# EasyEDA Pro project htx-studio-project_kpilekig-42ad306f.epro, board Controller
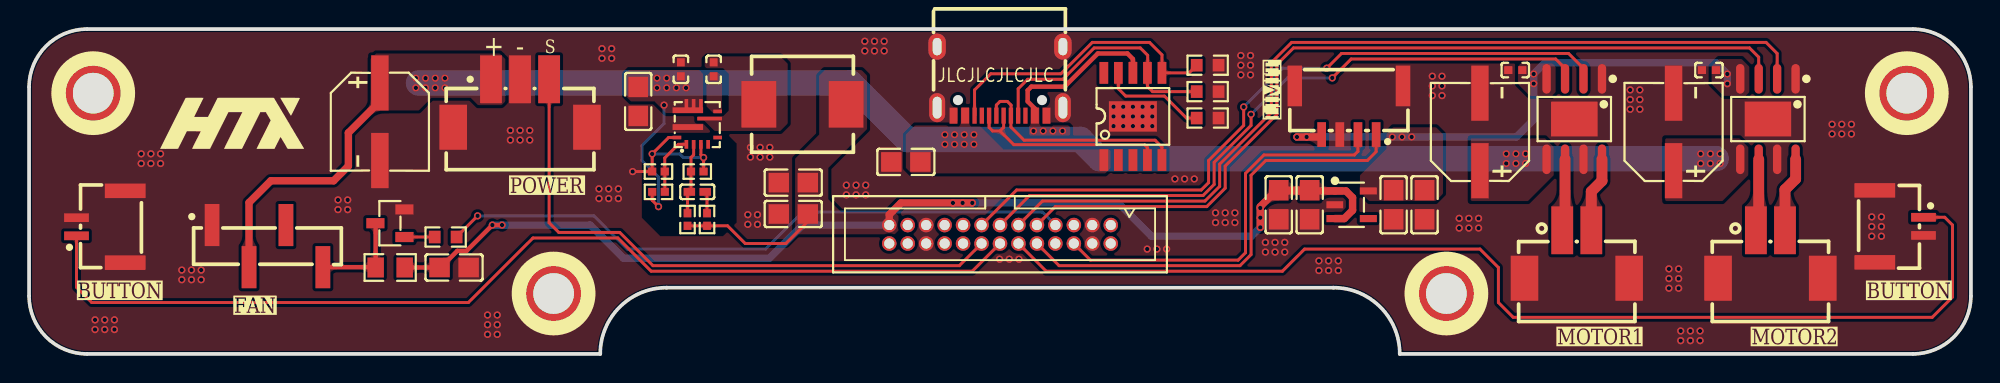
[diagram p6: board, top side]
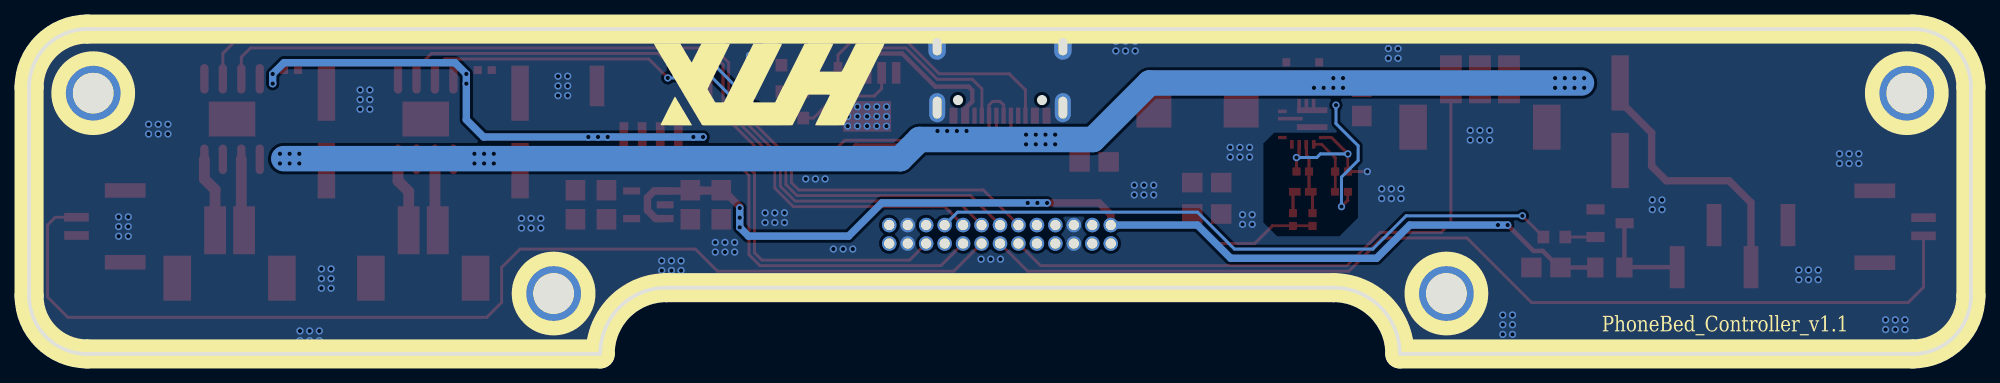
[diagram p7: board, bottom side, seen from below]

Outline 133.6 x 22.36 mm; copper layers: Top Layer, Bottom Layer. Coordinates in mm from the lower left corner of the outline.
Outline path: 0,18.36 arc(1.17,21.19) 4,22.36 129.6,22.36 arc(132.43,21.19) 133.6,18.36 133.6,4 arc(132.43,1.17) 129.6,0 94.31,0 arc(92.97,3.23) 89.74,4.56 43.86,4.56 arc(40.63,3.23) 39.3,0 4,0 arc(1.17,1.17) 0,4 0,18.36
Stack: Top Layer 0.035mm / Dielectric1 1.51mm FR4 er 4.5 / Bottom Layer 0.035mm

## Design rules (mm)
spacing copperThickness1oz (default): track to track 0.102, other pairs 0.152 to 0.3
spacing copperThickness2oz: track to track 0.203, other pairs 0.152 to 0.3
spacing Plane_innerPlane: track to track 0.102, other pairs 0.152 to 0.3
spacing Copper_copperRegion: track to track 0.102, other pairs 0.152 to 0.3
track width copperThickness1oz (default): min 0.127, default 0.203, max 2.54
track width copperThickness2oz: min 0.203, default 0.254, max 2.54
differential pair differentialPair (default): width min 0.127, default 0.254, max 2.54; gap min 0.152, default 0.152
net +3.3V uses copperRegion_copperThickness1oz
pour e438 uses Copper_copperRegion, copperRegion_Copper_copperRegion
pour e440 uses Copper_copperRegion, copperRegion_Copper_copperRegion
pour e442 uses Copper_copperRegion, copperRegion_Copper_copperRegion
pour e444 uses Copper_copperRegion, copperRegion_Copper_copperRegion
pour e446 uses Copper_copperRegion, copperRegion_Copper_copperRegion
pour e448 uses Copper_copperRegion, copperRegion_Copper_copperRegion
pour e450 uses Copper_copperRegion, copperRegion_Copper_copperRegion
pour e452 uses Copper_copperRegion, copperRegion_Copper_copperRegion
pour e454 uses Copper_copperRegion, copperRegion_Copper_copperRegion
pour e456 uses Copper_copperRegion, copperRegion_Copper_copperRegion
pour e458 uses Copper_copperRegion, copperRegion_Copper_copperRegion
pour e460 uses Copper_copperRegion, copperRegion_Copper_copperRegion
pour e658 uses Copper_copperRegion, copperRegion_Copper_copperRegion
pour e674 uses Copper_copperRegion, copperRegion_Copper_copperRegion

## Placement (name value [footprint] x y rotation side)
C1  22uF  [C0805]  60.32 13.22 0 top
C2  100uF  [CAP-SMD_BD6.3-L6.6-W6.6-FD-1]  24.14 15.98 270 top
C3  100pF  [C0402]  45.97 11.16 0 top
C4  10uF  [C0805]  88.11 10.27 90 top
C5  1uF  [C0805]  85.98 10.27 270 top
C6  10uF  [C0805]  93.88 10.27 90 top
C7  1uF  [C0805]  96.01 10.27 90 top
C8  100nF  [C0402#2]  47.1 19.59 90 top
C9  100nF  [C0402#2]  44.84 19.59 90 top
C10  22uF  [C0805]  52.58 9.63 0 top
C11  22uF  [C0805]  29.24 5.95 180 top
C12  22uF  [C0805]  52.58 11.79 0 top
C13  4.7uF  [C0805]  41.91 17.38 90 top
C15  100nF  [C0402#2]  102.25 19.54 0 top
C16  100uF  [CAP-SMD_BD6.3-L6.6-W6.6-FD-1]  99.82 15.28 90 top
C17  100nF  [C0402#2]  115.57 19.54 0 top
C18  100uF  [CAP-SMD_BD6.3-L6.6-W6.6-FD-1]  113.14 15.28 90 top
CN1  X1270WV-2x13A-9TV01  [IDC-TH_X1270WV-2X13A-6TV01]  66.8 8.24 180 top
CN2  WAFER-GH1.25-2PLB  [CONN-TH_2P-P1.25_XUNPU_WAFER-GH1.25-2PLB]  4.94 8.75 90 top
CN3  WAFER-GH1.25-2PLB  [CONN-TH_2P-P1.25_XUNPU_WAFER-GH1.25-2PLB]  128.66 8.78 270 top
L1  3.3uH  [IND-SMD_L7.0-W6.6]  53.21 17.18 0 top
LDO1  ME6211C33M5G-N  [SOT-23-5_L3.0-W1.7-P0.95-LS2.8-BL]  90.99 10.27 270 top
NOREF  -  [Pad_e199]  36.09 4.16 0 top
NOREF#2  -  [Pad_e198]  4.41 17.95 0 top
NOREF#3  -  [Pad_e201]  97.51 4.16 0 top
NOREF#4  -  [Pad_e200]  129.19 17.95 0 top
Q1  AO3400A  [SOT-23-3_L2.9-W1.3-P1.90-LS2.4-BR]  24.83 9 0 top
R1  5.1kΩ  [R0603]  81.09 18.06 180 top
R2  24kΩ  [R0603]  81.09 16.24 0 top
R3  5.1kΩ  [R0603]  81.09 19.87 180 top
R4  20kΩ  [R0402]  46.64 9.25 90 top
R5  73.2kΩ  [R0402]  45.3 9.25 270 top
R6  10kΩ  [R0402]  45.97 12.55 0 top
R7  2kΩ  [R0805]  24.84 5.95 180 top
R8  30kΩ  [R0402]  43.3 12.55 0 top
R9  10Ω  [R0603]  28.66 8.05 180 top
R10  169kΩ  [R0402]  43.31 11.16 180 top
U1  CH224A  [ESSOP-10_L4.9-W3.9-P1.0-LS6.0-TL-EP]  75.94 16.35 0 top
U2  DZ254S-11-04-50  [HDR-SMD_4P-P2.54-V-M-S4.8_DZ254S-11-04-50]  16.4 7.42 0 top
U3  TPS56637RPAR  [VQFN-HR-10_L3.0-W3.0_RPA]  45.97 15.79 90 top
U4  DRV8870DDAR  [HSOP-8_L5.0-W4.0-P1.27-LS6.2-BL-EP]  106.31 16.17 180 top
U5  WAFER-PH2.0-2PLB  [CONN-TH_2P-P2.00_XUNPU_WAFER-PH2.0-2PLB]  106.48 6.86 0 top
U6  DRV8870DDAR  [HSOP-8_L5.0-W4.0-P1.27-LS6.2-BL-EP]  119.63 16.17 180 top
U7  WAFER-PH2.0-2PLB  [CONN-TH_2P-P2.00_XUNPU_WAFER-PH2.0-2PLB]  119.8 6.86 0 top
U8  WAFER-PH2.0-3PLB  [CONN-SMD_3P-P2.00_XUNPU_WAFER-PH2.0-3PLB]  33.78 17.26 0 top
U9  WAFER-GH1.25-4PLB  [CONN-SMD_4P-P1.25_XUNPU_WAFER-GH1.25-4PLB]  90.8 16.77 180 top
USB1  TYPE-C 16PIN 2MD(073)  [USB-C-SMD_TYPE-C-6PIN-2MD-073]  66.8 18.78 180 top

## Footprints (pads in the part's own frame, mm; a bottom-side part is the same pattern mirrored in y, then rotated)
C0402
  rect 0.79x0.54 smd: 1(-0.545,0) 2(0.545,0)
C0402#2
  rect 0.566x0.54 smd: 1(-0.483,0) 2(0.483,0)
C0805
  rect 1.41x1.35 smd: 1(-1,0) 2(1,0)
CAP-SMD_BD6.3-L6.6-W6.6-FD-1
  rect 3.8x1.2 smd: 1(-2.67,0) 2(2.67,0)
CONN-SMD_3P-P2.00_XUNPU_WAFER-PH2.0-3PLB
  rect 1.5x3.3 smd: 1(-2,1.65) 2(0,1.65) 3(2,1.65)
  rect 1.9x3.1 smd: 4(4.6,-1.65) 5(-4.6,-1.65)
CONN-SMD_4P-P1.25_XUNPU_WAFER-GH1.25-4PLB
  rect 0.6x1.7 smd: 1(-1.875,1.675) 2(-0.625,1.675) 3(0.625,1.675) 4(1.875,1.675)
  rect 1x2.8 smd: 5(-3.725,-1.675) 6(3.725,-1.675)
CONN-TH_2P-P1.25_XUNPU_WAFER-GH1.25-2PLB
  rect 0.6x1.7 smd: 1(-0.625,1.675) 2(0.625,1.675)
  rect 1x2.8 smd: 3(2.475,-1.675) 4(-2.475,-1.675)
CONN-TH_2P-P2.00_XUNPU_WAFER-PH2.0-2PLB
  rect 1.5x3.3 smd: 1(-1,1.65) 2(1,1.65)
  rect 1.9x3.1 smd: 3(3.6,-1.65) 4(-3.6,-1.65)
ESSOP-10_L4.9-W3.9-P1.0-LS6.0-TL-EP
  rect 0.6x1.5 smd: 1(-2,-3) 2(-1,-3) 3(0,-3) 4(1,-3) 5(2,-3) 6(2,3) 7(1,3) 8(0,3) 9(-1,3) 10(-2,3)
  rect 3.3x2.1 smd: 11(0,0)
HDR-SMD_4P-P2.54-V-M-S4.8_DZ254S-11-04-50
  rect 1.02x2.9 smd: 1(-3.81,1.45) 2(-1.27,-1.45) 3(1.27,1.45) 4(3.81,-1.45)
HSOP-8_L5.0-W4.0-P1.27-LS6.2-BL-EP
  oval 0.574x2.038 smd: 1(-1.905,-2.769) 2(-0.635,-2.769) 3(0.635,-2.769) 4(1.905,-2.769) 5(1.905,2.769) 6(0.635,2.769) 7(-0.635,2.769) 8(-1.905,2.769)
  rect 3.2x2.4 smd: 9(0,0)
IDC-TH_X1270WV-2X13A-6TV01
  round 1 hole 0.7: 1(-7.62,-0.635) 2(-7.62,0.635) 3(-6.35,-0.635) 4(-6.35,0.635) 5(-5.08,-0.635) 6(-5.08,0.635) 7(-3.81,-0.635) 8(-3.81,0.635) 9(-2.54,-0.635) 10(-2.54,0.635) 11(-1.27,-0.635) 12(-1.27,0.635) 13(0,-0.635) 14(0,0.635) 15(1.27,-0.635) 16(1.27,0.635) 17(2.54,-0.635) 18(2.54,0.635) 19(3.81,-0.635) 20(3.81,0.635) 21(5.08,-0.635) 22(5.08,0.635) 23(6.35,-0.635) 24(6.35,0.635) 25(7.62,-0.635) 26(7.62,0.635)
IND-SMD_L7.0-W6.6
  rect 2.4x3.2 smd: 1(-3,0) 2(3,0)
Pad_e198
  round 4 hole 2.8: 1(0,0)
Pad_e199
  round 4 hole 2.8: 1(0,0)
Pad_e200
  round 4 hole 2.8: 1(0,0)
Pad_e201
  round 4 hole 2.8: 1(0,0)
R0402
  rect 0.566x0.54 smd: 1(-0.433,0) 2(0.433,0)
R0603
  rect 0.806x0.864 smd: 1(-0.753,0) 2(0.753,0)
R0805
  rect 1.133x1.377 smd: 1(-1,0) 2(1,0)
SOT-23-3_L2.9-W1.3-P1.90-LS2.4-BR
  rect 1.25x0.7 smd: 1(1,-0.95) 2(1,0.95) 3(-1,0)
SOT-23-5_L3.0-W1.7-P0.95-LS2.8-BL
  rect 0.49x1.157 smd: 1(-0.95,-1.153) 2(0,-1.153) 3(0.95,-1.153)
  rect 0.49x1.175 smd: 4(0.95,1.153) 5(-0.95,1.153)
USB-C-SMD_TYPE-C-6PIN-2MD-073
  rect 0.55x1.1 smd: 1(-3.2,2.375) 2(-2.4,2.375) 11(2.4,2.375) 12(3.2,2.375)
  rect 0.3x1.1 smd: 3(-1.75,2.375) 4(-1.25,2.375) 5(-0.75,2.375) 6(-0.25,2.375) 7(0.25,2.375) 8(0.75,2.375) 9(1.25,2.375) 10(1.75,2.375)
  oval 1.1x2 hole 0.6x1.5: 13(-4.325,1.825) 14(4.325,1.825)
  oval 1.2x1.8 hole 0.6x1.2: 13(-4.325,-2.375) 14(4.325,-2.375)
VQFN-HR-10_L3.0-W3.0_RPA
  rect 0.6x0.25 smd: 1(-1.36,0.75) 2(-1.36,0.25) 3(-1.36,-0.25) 4(-1.36,-0.75)
  rect 0.25x0.6 smd: 5(-0.89,-1.4) 7(0.91,-1.4) 10(-0.89,1.4)
  rect 0.25x1.7 smd: 6(0.41,-0.85)
  rect 0.4x2.1 smd: 8(0.99,0.65) 9(-0.17,0.65)
  rect 0.8x0.25 smd: 8(1.36,0.75) 8(1.36,0.25) 8(1.36,-0.25)

## Nets
As in the schematic.

Pads without a net: CN1 1 2 5 17 19 23 24 26; LDO1 4; NOREF 1; NOREF#2 1; NOREF#3 1; NOREF#4 1; U1 2 3 10; U2 3; U3 4 5; USB1 3 9

## Via types
v1: diameter 0.5, hole 0.3, Top Layer to Bottom Layer, 221 vias

## Routing (per net, layer and track width the routed paths; a pad name or vN(x,y) marks a point on that pad's centre or on a via; arc(x,y) is an arc through that point)
+3.3V: length 36.3
  Top Layer w0.508: v1(87.23,14.94) v1(87.9,14.94) 88.76,14.94 U9.4
  Bottom Layer w0.508: v1(116.84,18.6) v1(116.84,19.27) 116.06,20.05 104.29,20.05 v1(103.52,19.27) v1(103.52,18.6) 103.52,16.12 102.33,14.94 v1(95.12,14.94) v1(94.46,14.94) v1(93.79,14.94) v1(87.9,14.94) v1(87.23,14.94)
+5V: length 90.5
  Top Layer w0.203: R5.2 R4.1 48.06,8.82 49.27,7.6 52.07,7.6 53.58,9.11 C10.2
  Top Layer w0.305: v1(32.54,8.87) v1(31.88,8.87) 30.1,7.09 29.46,7.09 28.32,5.95 C11.2 R7.1
  Top Layer w0.508: 87.36,11.22 86.03,11.22 C5.1 ; 87.36,11.22 87.31,11.27 ; 87.36,11.22 LDO1.1 90.6,11.22 91.06,10.76 91.06,9.89 90.49,9.32 LDO1.3 ; CN1.25 59.18,9.59 59.99,10.39 v1(63.56,10.39) v1(64.23,10.39) v1(64.9,10.39) ; 87.31,11.27 C5.1 ; 87.31,11.27 C4.2 ; C5.1 85.83,11.27 84.71,10.14 v1(84.71,10.05) v1(84.71,9.38) v1(84.71,8.71)
  Bottom Layer w0.508: CN1.25 53.21,8.87 50.92,6.58 40.89,6.58 38.61,8.87 v1(32.54,8.87) v1(31.88,8.87) ; v1(63.56,10.39) v1(64.23,10.39) v1(64.9,10.39) 74.93,10.39 77.21,8.11 84.1,8.11 v1(84.71,8.71) v1(84.71,9.38) v1(84.71,10.05)
+12V: length 131
  Top Layer w0.203: R10.2 42.87,10.57 v1(43.31,10.14)
  Top Layer w0.305: U1.8 75.94,20.3 75.56,20.68 73.53,20.68 71.25,18.4 68.96,18.4 68.7,18.14 68.7,17.38 69.2,16.88 USB1.2
  Top Layer w0.508: C2.1 24.14,17.39 21.97,15.22 21.97,12.94 20.95,11.92 16.63,11.92 15.13,10.42 U2.2
  Bottom Layer w0.203: v1(43.31,10.14) 43.31,12.17 42.16,13.32 42.16,14.33 43.69,15.86 v1(43.69,17.13)
  Bottom Layer w1.75: 116.08,13.44 73.66,13.44 72.34,14.76 60.4,14.76 56.51,18.65 26.8,18.65
  vias: v1(26.61,18.98) v1(26.61,18.32) v1(27.28,18.98) v1(27.28,18.32) v1(27.94,18.98) v1(27.94,18.32) v1(28.61,18.98) v1(28.61,18.32) v1(43.2,18.98) v1(43.2,18.32) v1(43.87,18.98) v1(43.87,18.32) v1(44.53,18.32) v1(45.2,18.32) v1(63.01,15.09) v1(63.01,14.43) v1(63.67,15.09) v1(63.67,14.43) v1(64.34,15.09) v1(64.34,14.43) v1(65.01,15.09) v1(65.01,14.43) v1(69.1,15.35) v1(69.77,15.35) v1(70.44,15.35) v1(71.1,15.35) v1(101.63,13.78) v1(101.63,13.11) v1(102.29,13.78) v1(102.29,13.11) v1(102.96,13.78) v1(102.96,13.11) v1(115.01,13.78) v1(115.01,13.11) v1(115.67,13.78) v1(115.67,13.11) v1(116.34,13.78) v1(116.34,13.11)
GND: length 10.3
  Top Layer w0.203: R6.2 v1(46.41,13.52) 46.22,13.7 U3.3 ; U3.10 44,14.9 v1(42.87,13.77) R8.1 v1(41.53,12.55)
  Bottom Layer w0.203: v1(42.87,13.77) 44.76,13.77 45.01,13.52 v1(46.41,13.52)
  vias: v1(4.54,2.35) v1(4.54,1.68) v1(5.2,2.35) v1(5.2,1.68) v1(5.87,2.35) v1(5.87,1.68) v1(7.71,13.78) v1(7.71,13.11) v1(8.38,13.78) v1(8.38,13.11) v1(9.05,13.78) v1(9.05,13.11) v1(10.51,5.78) v1(10.51,5.11) v1(11.17,5.78) v1(11.17,5.11) v1(11.84,5.78) v1(11.84,5.11) v1(21.25,10.6) v1(21.25,9.93) v1(21.92,10.6) v1(21.92,9.93) v1(31.54,2.68) v1(31.54,2.01) v1(31.54,1.35) v1(32.21,2.68) v1(32.21,2.01) v1(32.21,1.35) v1(33.11,15.39) v1(33.11,14.72) v1(33.78,15.39) v1(33.78,14.72) v1(34.45,15.39) v1(34.45,14.72) v1(39.21,11.36) v1(39.21,10.7) v1(39.42,21.02) v1(39.42,20.35) v1(39.88,11.36) v1(39.88,10.7) v1(40.08,21.02) v1(40.08,20.35) v1(40.54,11.36) v1(40.54,10.7) v1(49.45,9.59) v1(49.45,8.92) v1(49.63,14.22) v1(49.63,13.55) v1(50.12,9.59) v1(50.12,8.92) v1(50.29,14.22) v1(50.29,13.55) v1(50.96,14.22) v1(50.96,13.55) v1(56.23,11.62) v1(56.23,10.95) v1(56.89,11.62) v1(56.89,10.95) v1(57.5,21.52) v1(57.5,20.86) v1(57.56,11.62) v1(57.56,10.95) v1(58.16,21.52) v1(58.16,20.86) v1(58.83,21.52) v1(58.83,20.86) v1(66.77,6.52) v1(67.44,6.52) v1(68.1,6.52) v1(74.61,17.01) v1(74.61,16.35) v1(74.61,15.68) v1(75.28,17.01) v1(75.28,16.35) v1(75.28,15.68) v1(75.94,17.01) v1(75.94,16.35) v1(75.94,15.68) v1(76.61,17.01) v1(76.61,16.35) v1(76.61,15.68) v1(76.93,7.22) v1(77.28,17.01) v1(77.28,16.35) v1(77.28,15.68) v1(77.59,7.22) v1(78.26,7.22) v1(78.83,12.05) v1(79.5,12.05) v1(80.17,12.05) v1(81.63,9.71) v1(81.63,9.05) v1(82.29,9.71) v1(82.29,9.05) v1(82.96,9.71) v1(82.96,9.05) v1(83.37,20.54) v1(83.37,19.87) v1(83.37,19.21) v1(84.03,20.54) v1(84.03,19.87) v1(84.03,19.21) v1(85.06,7.68) v1(85.06,7.01) v1(85.72,7.68) v1(85.72,7.01) v1(86.39,7.68) v1(86.39,7.01) v1(88.74,6.41) v1(88.74,5.74) v1(89.41,6.41) v1(89.41,5.74) v1(90.07,6.41) v1(90.07,5.74) v1(96.54,19.12) v1(96.54,18.45) v1(96.54,17.78) v1(97.21,19.12) v1(97.21,18.45) v1(97.21,17.78) v1(98.39,9.33) v1(98.39,8.66) v1(99.06,9.33) v1(99.06,8.66) v1(99.72,9.33) v1(99.72,8.66) v1(110.15,18.17) v1(110.15,17.51) v1(110.15,16.84) v1(110.82,18.17) v1(110.82,17.51) v1(110.82,16.84) v1(112.82,5.86) v1(112.82,5.19) v1(112.82,4.52) v1(113.49,5.86) v1(113.49,5.19) v1(113.49,4.52) v1(113.63,1.58) v1(113.63,0.92) v1(114.3,1.58) v1(114.3,0.92) v1(114.97,1.58) v1(114.97,0.92) v1(124.05,15.81) v1(124.05,15.14) v1(124.71,15.81) v1(124.71,15.14) v1(125.38,15.81) v1(125.38,15.14) v1(126.78,9.43) v1(126.78,8.77) v1(126.78,8.1) v1(127.44,9.43) v1(127.44,8.77) v1(127.44,8.1)
BUTTON_LEFT: length 71.1
  Top Layer w0.203: CN1.14 64.9,5.7 42.8,5.7 40.51,7.98 34.67,7.98 30.22,3.54 4.32,3.54 3.26,4.59 CN2.1
BUTTON_RIGHT: length 76.8
  Top Layer w0.203: CN1.12 69.97,5.7 86.23,5.7 87.75,7.22 99.82,7.22 101.09,5.95 101.09,3.54 102.11,2.52 130.94,2.52 132.33,3.92 132.33,8.87 131.8,9.41 130.34,9.41
CC1: length 17.8
  Top Layer w0.203: USB1.4 68.05,18.25 68.7,18.9 71.12,18.9 73.28,21.06 76.45,21.06 76.96,20.55 76.96,19.36 U1.7 76.94,18.41 77.3,18.06 R1.2
CC2: length 20.2
  Top Layer w0.203: R3.2 79.81,19.35 U1.6 77.94,20.59 77.09,21.44 73.15,21.44 70.99,19.28 66.16,19.28 65.05,18.17 USB1.10
CHARGE: length 41.5
  Top Layer w0.203: CN1.16 64.01,6.08 42.92,6.08 40.64,8.36 36.45,8.36 35.78,9.03 U8.3
DN_USB: length 15.3
  Top Layer w0.203: USB1.7 66.55,17.13 66.8,17.38 67.31,17.38 67.56,17.13 67.56,16.41 USB1.5 67.55,15.61 68.45,14.71 77.47,14.71 77.94,14.24 U1.5
DP_USB: length 14.3
  Top Layer w0.203: 66.8,15.35 67.74,14.4 76.74,14.4 76.94,14.2 U1.4 ; 66.8,15.35 66.29,15.35 66.05,15.59 USB1.8 ; 66.8,15.35 67.05,15.6 USB1.6
FAN_PWM: length 44.2
  Top Layer w0.203: v1(30.86,9.51) 29.41,8.06 R9.1
  Bottom Layer w0.203: v1(30.86,9.51) 38.86,9.51 41.15,7.22 50.67,7.22 53.21,9.76 69.72,9.76 CN1.7
GPIO2: length 59.4
  Top Layer w0.203: U6.3 119,20.43 118.36,21.06 86.99,21.06 85.85,19.92 85.85,16.49 82.29,12.94 82.29,11.41 81.02,10.14 70.61,10.14 CN1.9
GPIO3: length 62.4
  Top Layer w0.203: U6.2 120.27,20.68 119.5,21.44 86.87,21.44 85.47,20.05 85.47,16.62 81.91,13.06 81.91,11.54 80.9,10.52 69.72,10.52 CN1.11
GPIO4: length 45.9
  Top Layer w0.203: v1(89.66,19) 90.96,20.3 105.03,20.3 105.68,19.65 U4.3 ; CN1.13 68.83,10.9 80.77,10.9 81.53,11.66 81.53,13.19 84.07,15.73 v1(84.07,16.49)
  Bottom Layer w0.203: v1(84.07,16.49) 86.58,19 v1(89.66,19)
GPIO5: length 49.1
  Top Layer w0.203: v1(83.56,17) 83.56,15.73 81.15,13.32 81.15,11.79 80.64,11.28 67.94,11.28 CN1.15 ; v1(89.28,19.67) 90.29,20.68 105.92,20.68 106.95,19.65 U4.2
  Bottom Layer w0.203: v1(89.28,19.67) 86.23,19.67 v1(83.56,17)
GPIO38: length 27.5
  Top Layer w0.203: U9.2 91.43,13.94 91.18,13.7 84.96,13.7 83.69,12.43 83.69,6.97 83.18,6.46 73.02,6.46 CN1.6
GPIO40: length 31.6
  Top Layer w0.203: U9.1 92.68,13.92 92.07,13.32 85.09,13.32 84.07,12.3 84.07,6.84 83.31,6.08 70.86,6.08 CN1.10
PWM: length 6.7
  Top Layer w0.305: Q1.3 23.84,8.98 R7.2 23.82,5.97 U2.4
$1N4160: length 4.9
  Top Layer w0.203: R5.1 45.3,11.03 C3.1 45.54,11.27 R6.1 45.54,13.52 45.72,13.7 U3.2
$1N4164: length 4.2
  Top Layer w0.203: U3.1 44.67,14.43 43.73,13.49 R8.2 43.74,12.55 R10.1
$1N4165: length 1.5
  Top Layer w0.203: C3.2 46.64,11.03 R4.2
$1N6596: length 5
  Top Layer w0.75: U4.6 105.68,8.71 U5.1
$1N6603: length 5.2
  Top Layer w0.75: U5.2 107.48,11.18 108.22,11.91 U4.8
$1N7324: length 5
  Top Layer w0.75: U6.6 119,8.71 U7.1
$1N7332: length 5.2
  Top Layer w0.75: U6.8 121.54,12.04 120.8,11.31 U7.2
$1N13302: length 2.1
  Top Layer w0.203: R9.2 Q1.1
$1N14108: length 7.3
  Top Layer w0.203: U1.9 74.94,18.25 75.45,17.75 78.11,17.75 79.63,16.24 R2.1

## Copper pours and planes (outline as drawn; the poured copper is in the pictures)
+3.3V on Top Layer: 102.44,18.58 102.44,19.8 102.68,20.05 104.76,20.05 105.03,19.78 105.03,18.02 104.77,17.76 103.25,17.76
+3.3V on Top Layer: 91.56,11.16 91.56,12.3 93.39,14.13 93.39,15.14 93.85,15.6 96.8,15.6 97.28,15.12 97.28,11.03 96.77,10.52 92.2,10.52
+3.3V on Top Layer: 115.76,18.58 115.76,19.8 116.26,20.3 117.82,20.3 118.35,19.78 118.35,18.02 118.09,17.76 116.57,17.76
+5V on Top Layer: 54.35,15.09 52.7,13.44 52.7,8.24 59.56,8.24 59.81,8.49 59.81,9.51 59.56,9.76 55.88,9.76 54.99,10.65 54.99,12.81 57.66,15.47 57.66,19.16 57.28,19.54 54.73,19.54 54.35,19.16
+12V on Top Layer: 112.56,10.52 112.56,14.84 117.67,14.84 118.28,14.24 118.28,12.3 116.5,10.52
+12V on Top Layer: 23.51,16.76 26.81,16.76 27.68,17.63 30.38,17.63 30.89,17.13 32.51,17.13 32.76,17.38 32.76,20.3 32.38,20.68 23.87,20.68 23.49,20.3 23.49,16.77
+12V on Top Layer: 68.8,15.13 68.96,14.97 71.5,14.97 71.63,15.09 71.63,15.6 71.5,15.73 69.72,15.73 69.59,15.86 69.59,16.87 69.47,17 68.96,17 68.8,16.84
+12V on Top Layer: 99.19,10.52 99.19,14.84 104.3,14.84 104.9,14.24 104.9,12.3 103.12,10.52
+12V on Top Layer: 64.1,15.95 63.88,15.73 60.96,15.73 60.32,15.09 60.32,12.81 60.7,12.43 74.04,12.43 74.42,12.81 74.42,13.95 74.29,14.08 67.05,14.08 65.4,15.73 64.9,15.73 64.77,15.86 64.77,16.87 64.64,17 64.2,17 64.1,16.9
+12V on Top Layer: 46.37,16.58 43.83,16.58 43.02,17.38 41.41,17.38 41,17.78 41,19.27 41.27,19.54 46.12,19.54 46.37,19.29
GND on Top Layer: 94.31,0 92.97,3.23 89.74,4.56 43.86,4.56 40.63,3.23 39.3,0 4,0 1.17,1.17 0,4 0,18.36 1.17,21.19 4,22.36 129.6,22.36 132.43,21.19 133.6,18.36 133.6,4 132.43,1.17 129.6,0
GND on Bottom Layer: 94.31,0 92.97,3.23 89.74,4.56 43.86,4.56 40.63,3.23 39.3,0 4,0 1.17,1.17 0,4 0,18.36 1.17,21.19 4,22.36 129.6,22.36 132.43,21.19 133.6,18.36 133.6,4 132.43,1.17 129.6,0
$1N4161 on Top Layer: 47.67,16.57 47.67,19.11 47.45,19.34 46.78,19.34 46.61,19.16 46.61,17.04 47.07,16.57
$1N4162 on Top Layer: 45.97,16.07 45.97,16.36 47.75,16.36 48.13,16.75 48.13,19.28 47.75,19.67 46.61,19.67 46.48,19.79 46.48,20.3 46.66,20.48 51.69,20.48 52.19,19.97 52.19,15.86 51.69,15.35 47.17,15.35 46.44,16.07

Small or netless copper shapes (teardrops, artwork), in the pictures only: 91 on Top Layer, 11 on Bottom Layer

## Text on the board
Bottom Silkscreen Layer: PhoneBed_Controller_v1.1
Top Silkscreen Layer: JLCJLCJLCJLC | S | BUTTON | FAN | POWER | MOTOR1 | MOTOR2 | LIMIT | + | -
